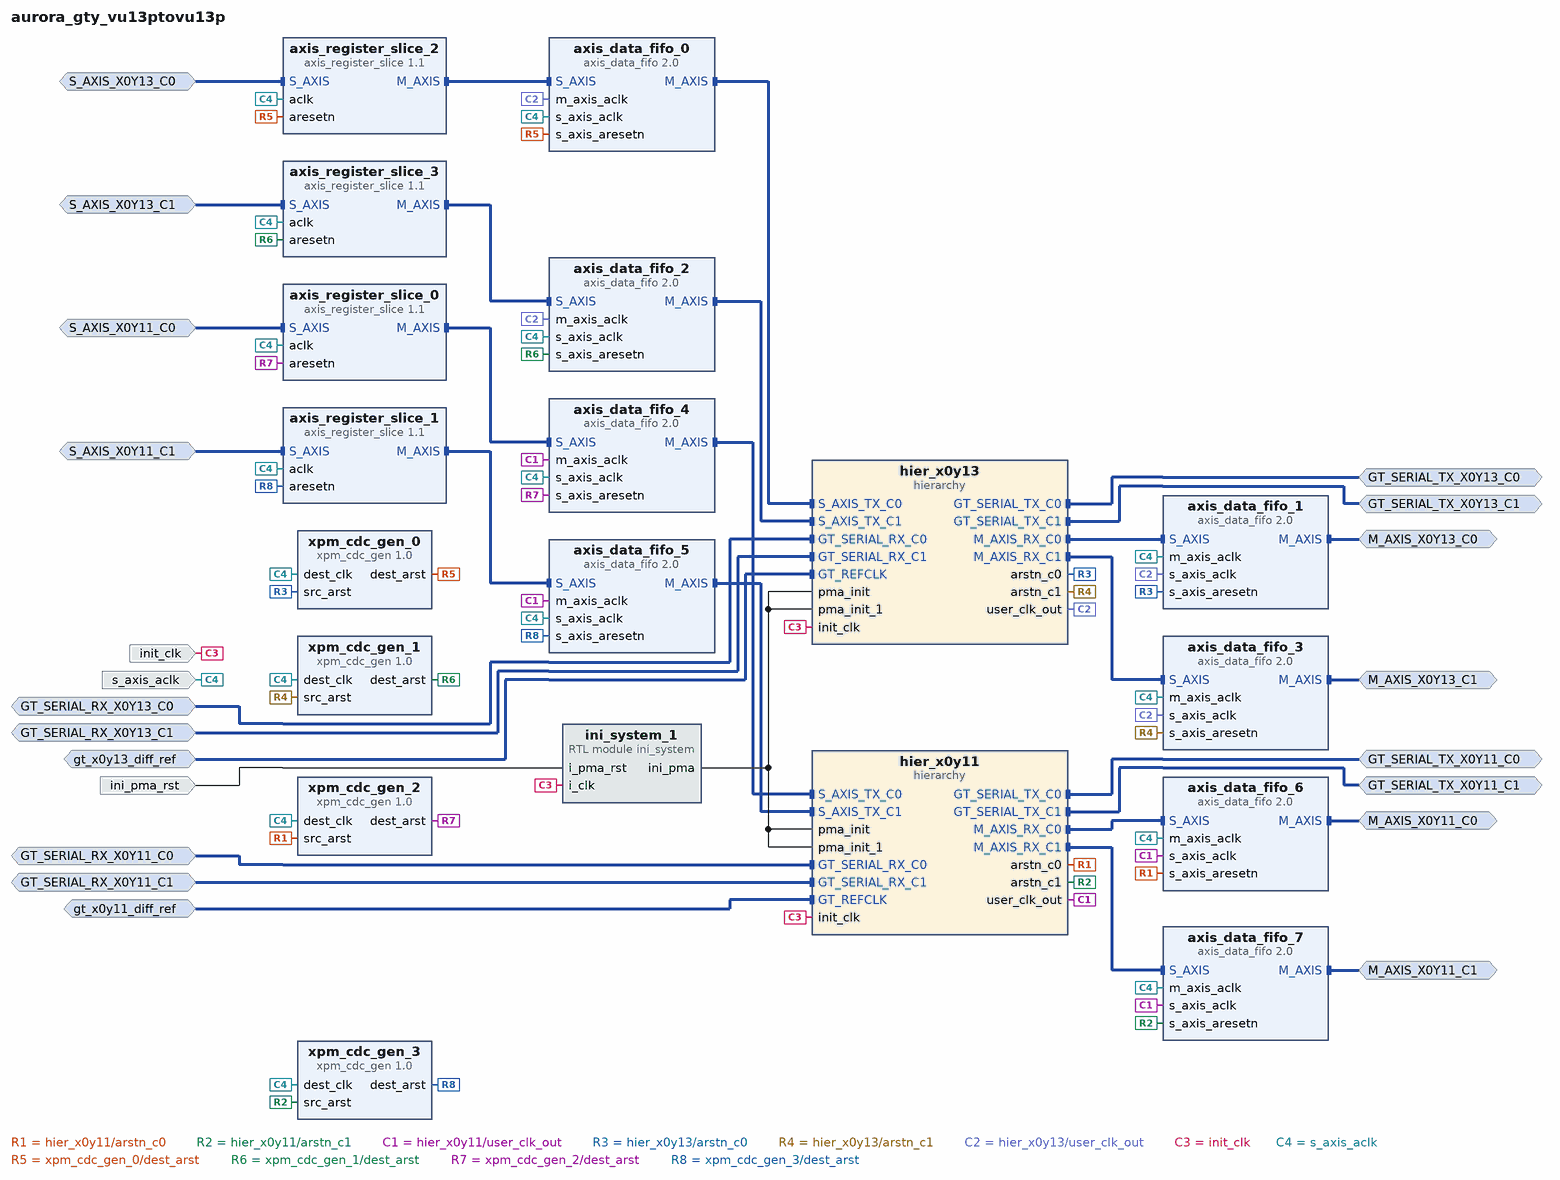
[diagram p0: block diagram of the top level]
# Vivado block design aurora_gty_vu13ptovu13p, xcvu13p-fhgb2104-2-i, Vivado 2025.2
create_bd_design aurora_gty_vu13ptovu13p

create_bd_intf_port -mode Slave -vlnv xilinx.com:interface:axis_rtl:1.0 S_AXIS_X0Y11_C0
set_property -dict [list \
  CONFIG.FREQ_HZ 256000000 \
  CONFIG.HAS_TKEEP 0 \
  CONFIG.HAS_TLAST 1 \
  CONFIG.HAS_TREADY 1 \
  CONFIG.HAS_TSTRB 0 \
  CONFIG.LAYERED_METADATA undef \
  CONFIG.TDATA_NUM_BYTES 16 \
  CONFIG.TDEST_WIDTH 0 \
  CONFIG.TID_WIDTH 0 \
  CONFIG.TUSER_WIDTH 64 \
] [get_bd_intf_ports S_AXIS_X0Y11_C0]
create_bd_intf_port -mode Slave -vlnv xilinx.com:interface:axis_rtl:1.0 S_AXIS_X0Y13_C1
set_property -dict [list \
  CONFIG.FREQ_HZ 256000000 \
  CONFIG.HAS_TKEEP 0 \
  CONFIG.HAS_TLAST 1 \
  CONFIG.HAS_TREADY 1 \
  CONFIG.HAS_TSTRB 0 \
  CONFIG.LAYERED_METADATA undef \
  CONFIG.TDATA_NUM_BYTES 16 \
  CONFIG.TDEST_WIDTH 0 \
  CONFIG.TID_WIDTH 0 \
  CONFIG.TUSER_WIDTH 64 \
] [get_bd_intf_ports S_AXIS_X0Y13_C1]
create_bd_intf_port -mode Master -vlnv xilinx.com:interface:axis_rtl:1.0 M_AXIS_X0Y11_C0
set_property -dict {CONFIG.FREQ_HZ 256000000} [get_bd_intf_ports M_AXIS_X0Y11_C0]
create_bd_intf_port -mode Master -vlnv xilinx.com:interface:axis_rtl:1.0 M_AXIS_X0Y13_C0
set_property -dict {CONFIG.FREQ_HZ 256000000} [get_bd_intf_ports M_AXIS_X0Y13_C0]
create_bd_intf_port -mode Master -vlnv xilinx.com:interface:axis_rtl:1.0 M_AXIS_X0Y11_C1
set_property -dict {CONFIG.FREQ_HZ 256000000} [get_bd_intf_ports M_AXIS_X0Y11_C1]
create_bd_intf_port -mode Slave -vlnv xilinx.com:interface:diff_clock_rtl:1.0 gt_x0y11_diff_ref
set_property -dict {CONFIG.FREQ_HZ 156250000} [get_bd_intf_ports gt_x0y11_diff_ref]
create_bd_intf_port -mode Slave -vlnv xilinx.com:interface:axis_rtl:1.0 S_AXIS_X0Y11_C1
set_property -dict [list \
  CONFIG.FREQ_HZ 256000000 \
  CONFIG.HAS_TKEEP 0 \
  CONFIG.HAS_TLAST 1 \
  CONFIG.HAS_TREADY 1 \
  CONFIG.HAS_TSTRB 0 \
  CONFIG.LAYERED_METADATA undef \
  CONFIG.TDATA_NUM_BYTES 16 \
  CONFIG.TDEST_WIDTH 0 \
  CONFIG.TID_WIDTH 0 \
  CONFIG.TUSER_WIDTH 64 \
] [get_bd_intf_ports S_AXIS_X0Y11_C1]
create_bd_intf_port -mode Master -vlnv xilinx.com:interface:axis_rtl:1.0 M_AXIS_X0Y13_C1
set_property -dict {CONFIG.FREQ_HZ 256000000} [get_bd_intf_ports M_AXIS_X0Y13_C1]
create_bd_intf_port -mode Slave -vlnv xilinx.com:display_aurora64b66b:GT_Serial_Transceiver_Pins_RX_rtl:1.0 GT_SERIAL_RX_X0Y13_C0
create_bd_intf_port -mode Master -vlnv xilinx.com:display_aurora64b66b:GT_Serial_Transceiver_Pins_TX_rtl:1.0 GT_SERIAL_TX_X0Y13_C0
create_bd_intf_port -mode Slave -vlnv xilinx.com:display_aurora64b66b:GT_Serial_Transceiver_Pins_RX_rtl:1.0 GT_SERIAL_RX_X0Y11_C0
create_bd_intf_port -mode Master -vlnv xilinx.com:display_aurora64b66b:GT_Serial_Transceiver_Pins_TX_rtl:1.0 GT_SERIAL_TX_X0Y11_C0
create_bd_intf_port -mode Slave -vlnv xilinx.com:display_aurora64b66b:GT_Serial_Transceiver_Pins_RX_rtl:1.0 GT_SERIAL_RX_X0Y13_C1
create_bd_intf_port -mode Master -vlnv xilinx.com:display_aurora64b66b:GT_Serial_Transceiver_Pins_TX_rtl:1.0 GT_SERIAL_TX_X0Y13_C1
create_bd_intf_port -mode Slave -vlnv xilinx.com:display_aurora64b66b:GT_Serial_Transceiver_Pins_RX_rtl:1.0 GT_SERIAL_RX_X0Y11_C1
create_bd_intf_port -mode Master -vlnv xilinx.com:display_aurora64b66b:GT_Serial_Transceiver_Pins_TX_rtl:1.0 GT_SERIAL_TX_X0Y11_C1
create_bd_intf_port -mode Slave -vlnv xilinx.com:interface:axis_rtl:1.0 S_AXIS_X0Y13_C0
set_property -dict [list \
  CONFIG.FREQ_HZ 256000000 \
  CONFIG.HAS_TKEEP 0 \
  CONFIG.HAS_TLAST 1 \
  CONFIG.HAS_TREADY 1 \
  CONFIG.HAS_TSTRB 0 \
  CONFIG.LAYERED_METADATA undef \
  CONFIG.TDATA_NUM_BYTES 16 \
  CONFIG.TDEST_WIDTH 0 \
  CONFIG.TID_WIDTH 0 \
  CONFIG.TUSER_WIDTH 64 \
] [get_bd_intf_ports S_AXIS_X0Y13_C0]
create_bd_intf_port -mode Slave -vlnv xilinx.com:interface:diff_clock_rtl:1.0 gt_x0y13_diff_ref
set_property -dict {CONFIG.FREQ_HZ 156250000} [get_bd_intf_ports gt_x0y13_diff_ref]
create_bd_port -dir I -type rst ini_pma_rst
create_bd_port -dir I -type clk s_axis_aclk
set_property -dict [list \
  CONFIG.ASSOCIATED_BUSIF S_AXIS_X0Y11_C0:S_AXIS_X0Y13_C1:M_AXIS_X0Y11_C0:M_AXIS_X0Y13_C0:M_AXIS_X0Y11_C0_1:S_AXIS_X0Y11_C0_1:M_AXIS_X0Y13_C0_1:S_AXIS_X0Y13_C1_1:M_AXIS_X0Y11_C1:S_AXIS_X0Y11_C1:M_AXIS_X0Y13_C1:S_AXIS_X0Y13_C0 \
  CONFIG.FREQ_HZ 256000000 \
] [get_bd_ports s_axis_aclk]
create_bd_port -dir I -type clk init_clk
set_property -dict {CONFIG.ASSOCIATED_RESET ini_pma_rst CONFIG.FREQ_HZ 100000000} [get_bd_ports init_clk]

create_bd_cell -type hier hier_x0y13
create_bd_cell -type hier hier_x0y11
create_bd_cell -type module -reference ini_system ini_system_1
create_bd_cell -type ip -vlnv xilinx.com:ip:axis_data_fifo:2.0 axis_data_fifo_0
set_property -dict [list \
  CONFIG.FIFO_DEPTH 512 \
  CONFIG.HAS_TLAST 1 \
  CONFIG.IS_ACLK_ASYNC 1 \
  CONFIG.TDATA_NUM_BYTES 16 \
  CONFIG.TUSER_WIDTH 64 \
] [get_bd_cells axis_data_fifo_0]
create_bd_cell -type ip -vlnv xilinx.com:ip:axis_data_fifo:2.0 axis_data_fifo_2
set_property -dict [list \
  CONFIG.FIFO_DEPTH 512 \
  CONFIG.HAS_TLAST 1 \
  CONFIG.IS_ACLK_ASYNC 1 \
  CONFIG.TDATA_NUM_BYTES 16 \
  CONFIG.TUSER_WIDTH 64 \
] [get_bd_cells axis_data_fifo_2]
create_bd_cell -type ip -vlnv xilinx.com:ip:xpm_cdc_gen:1.0 xpm_cdc_gen_0
set_property -dict {CONFIG.CDC_TYPE xpm_cdc_async_rst} [get_bd_cells xpm_cdc_gen_0]
create_bd_cell -type ip -vlnv xilinx.com:ip:xpm_cdc_gen:1.0 xpm_cdc_gen_1
set_property -dict {CONFIG.CDC_TYPE xpm_cdc_async_rst} [get_bd_cells xpm_cdc_gen_1]
create_bd_cell -type ip -vlnv xilinx.com:ip:axis_data_fifo:2.0 axis_data_fifo_1
set_property -dict [list \
  CONFIG.FIFO_DEPTH 512 \
  CONFIG.HAS_TLAST 1 \
  CONFIG.IS_ACLK_ASYNC 1 \
  CONFIG.TDATA_NUM_BYTES 16 \
  CONFIG.TUSER_WIDTH 64 \
] [get_bd_cells axis_data_fifo_1]
create_bd_cell -type ip -vlnv xilinx.com:ip:axis_data_fifo:2.0 axis_data_fifo_3
set_property -dict [list \
  CONFIG.FIFO_DEPTH 512 \
  CONFIG.HAS_TLAST 1 \
  CONFIG.IS_ACLK_ASYNC 1 \
  CONFIG.TDATA_NUM_BYTES 16 \
  CONFIG.TUSER_WIDTH 64 \
] [get_bd_cells axis_data_fifo_3]
create_bd_cell -type ip -vlnv xilinx.com:ip:axis_data_fifo:2.0 axis_data_fifo_4
set_property -dict [list \
  CONFIG.FIFO_DEPTH 512 \
  CONFIG.HAS_TLAST 1 \
  CONFIG.IS_ACLK_ASYNC 1 \
  CONFIG.TDATA_NUM_BYTES 16 \
  CONFIG.TUSER_WIDTH 64 \
] [get_bd_cells axis_data_fifo_4]
create_bd_cell -type ip -vlnv xilinx.com:ip:axis_data_fifo:2.0 axis_data_fifo_5
set_property -dict [list \
  CONFIG.FIFO_DEPTH 512 \
  CONFIG.HAS_TLAST 1 \
  CONFIG.IS_ACLK_ASYNC 1 \
  CONFIG.TDATA_NUM_BYTES 16 \
  CONFIG.TUSER_WIDTH 64 \
] [get_bd_cells axis_data_fifo_5]
create_bd_cell -type ip -vlnv xilinx.com:ip:xpm_cdc_gen:1.0 xpm_cdc_gen_2
set_property -dict {CONFIG.CDC_TYPE xpm_cdc_async_rst} [get_bd_cells xpm_cdc_gen_2]
create_bd_cell -type ip -vlnv xilinx.com:ip:xpm_cdc_gen:1.0 xpm_cdc_gen_3
set_property -dict {CONFIG.CDC_TYPE xpm_cdc_async_rst} [get_bd_cells xpm_cdc_gen_3]
create_bd_cell -type ip -vlnv xilinx.com:ip:axis_data_fifo:2.0 axis_data_fifo_6
set_property -dict [list \
  CONFIG.FIFO_DEPTH 512 \
  CONFIG.HAS_TLAST 1 \
  CONFIG.IS_ACLK_ASYNC 1 \
  CONFIG.TDATA_NUM_BYTES 16 \
  CONFIG.TUSER_WIDTH 64 \
] [get_bd_cells axis_data_fifo_6]
create_bd_cell -type ip -vlnv xilinx.com:ip:axis_data_fifo:2.0 axis_data_fifo_7
set_property -dict [list \
  CONFIG.FIFO_DEPTH 512 \
  CONFIG.HAS_TLAST 1 \
  CONFIG.IS_ACLK_ASYNC 1 \
  CONFIG.TDATA_NUM_BYTES 16 \
  CONFIG.TUSER_WIDTH 64 \
] [get_bd_cells axis_data_fifo_7]
create_bd_cell -type ip -vlnv xilinx.com:ip:axis_register_slice:1.1 axis_register_slice_0
set_property -dict [list \
  CONFIG.NUM_SLR_CROSSINGS 3 \
  CONFIG.PIPELINES_MASTER 2 \
  CONFIG.PIPELINES_MIDDLE 2 \
  CONFIG.PIPELINES_SLAVE 2 \
  CONFIG.REG_CONFIG 15 \
] [get_bd_cells axis_register_slice_0]
create_bd_cell -type ip -vlnv xilinx.com:ip:axis_register_slice:1.1 axis_register_slice_1
set_property -dict [list \
  CONFIG.NUM_SLR_CROSSINGS 3 \
  CONFIG.PIPELINES_MASTER 2 \
  CONFIG.PIPELINES_MIDDLE 2 \
  CONFIG.PIPELINES_SLAVE 2 \
  CONFIG.REG_CONFIG 15 \
] [get_bd_cells axis_register_slice_1]
create_bd_cell -type ip -vlnv xilinx.com:ip:axis_register_slice:1.1 axis_register_slice_2
set_property -dict [list \
  CONFIG.NUM_SLR_CROSSINGS 3 \
  CONFIG.PIPELINES_MASTER 2 \
  CONFIG.PIPELINES_MIDDLE 2 \
  CONFIG.PIPELINES_SLAVE 2 \
  CONFIG.REG_CONFIG 15 \
] [get_bd_cells axis_register_slice_2]
create_bd_cell -type ip -vlnv xilinx.com:ip:axis_register_slice:1.1 axis_register_slice_3
set_property -dict [list \
  CONFIG.NUM_SLR_CROSSINGS 3 \
  CONFIG.PIPELINES_MASTER 2 \
  CONFIG.PIPELINES_MIDDLE 2 \
  CONFIG.PIPELINES_SLAVE 2 \
  CONFIG.REG_CONFIG 15 \
] [get_bd_cells axis_register_slice_3]

# ---- hierarchy /hier_x0y13 ----
current_bd_instance /hier_x0y13
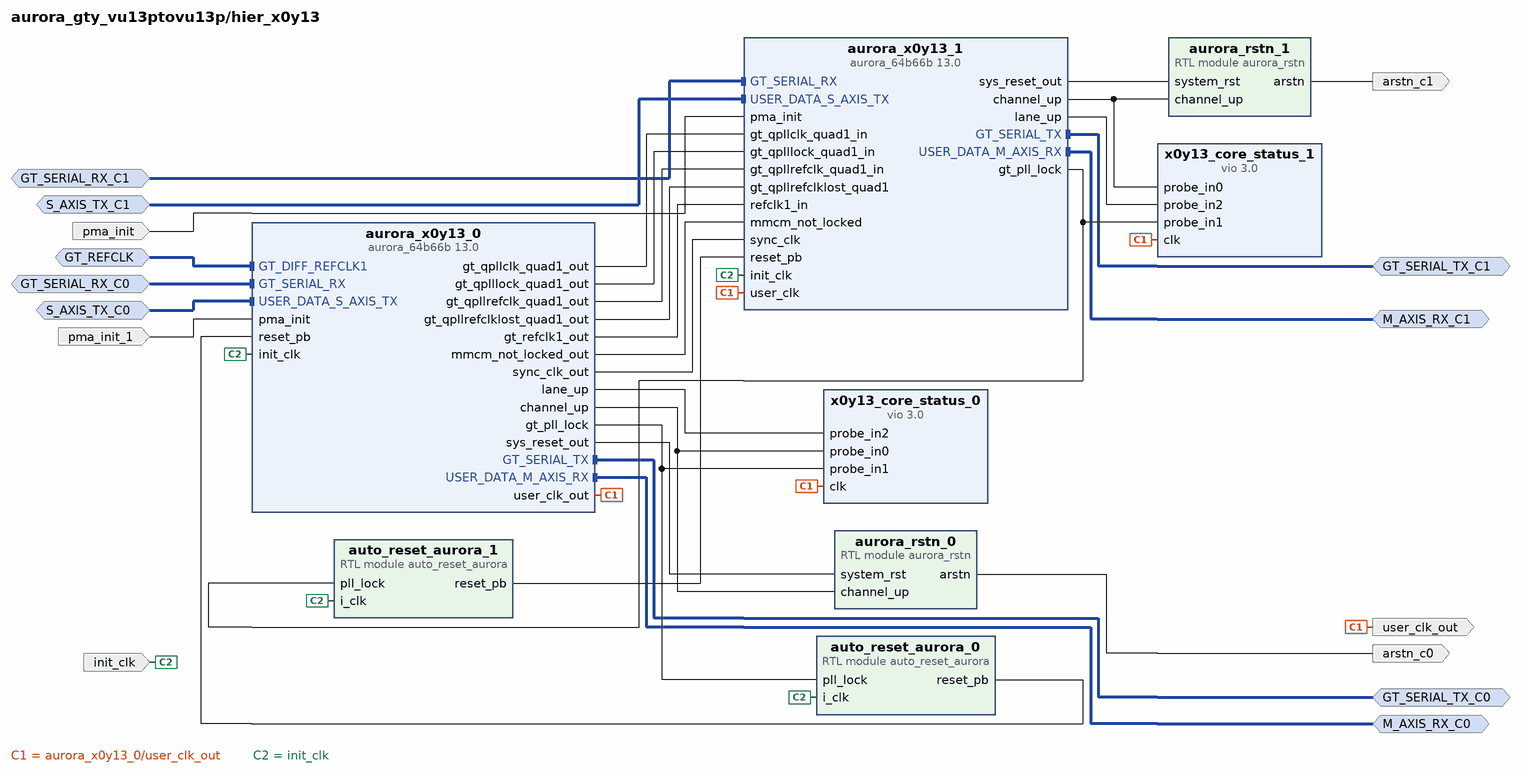
[diagram p1: block diagram inside /hier_x0y13]
create_bd_intf_pin -mode Slave -vlnv xilinx.com:interface:axis_rtl:1.0 S_AXIS_TX_C0
create_bd_intf_pin -mode Master -vlnv xilinx.com:interface:axis_rtl:1.0 M_AXIS_RX_C0
create_bd_intf_pin -mode Slave -vlnv xilinx.com:interface:diff_clock_rtl:1.0 GT_REFCLK
create_bd_intf_pin -mode Master -vlnv xilinx.com:display_aurora64b66b:GT_Serial_Transceiver_Pins_TX_rtl:1.0 GT_SERIAL_TX_C0
create_bd_intf_pin -mode Slave -vlnv xilinx.com:display_aurora64b66b:GT_Serial_Transceiver_Pins_RX_rtl:1.0 GT_SERIAL_RX_C0
create_bd_intf_pin -mode Slave -vlnv xilinx.com:interface:axis_rtl:1.0 S_AXIS_TX_C1
create_bd_intf_pin -mode Master -vlnv xilinx.com:interface:axis_rtl:1.0 M_AXIS_RX_C1
create_bd_intf_pin -mode Master -vlnv xilinx.com:display_aurora64b66b:GT_Serial_Transceiver_Pins_TX_rtl:1.0 GT_SERIAL_TX_C1
create_bd_intf_pin -mode Slave -vlnv xilinx.com:display_aurora64b66b:GT_Serial_Transceiver_Pins_RX_rtl:1.0 GT_SERIAL_RX_C1
create_bd_pin -dir O -type clk user_clk_out
create_bd_pin -dir I -type clk init_clk
create_bd_pin -dir I -type rst pma_init
create_bd_pin -dir I -type rst pma_init_1
create_bd_pin -dir O arstn_c0
create_bd_pin -dir O arstn_c1

create_bd_cell -type ip -vlnv xilinx.com:ip:vio:3.0 x0y13_core_status_0
set_property -dict [list \
  CONFIG.C_NUM_PROBE_IN 3 \
  CONFIG.C_NUM_PROBE_OUT 0 \
  CONFIG.C_PROBE_IN2_WIDTH 2 \
  CONFIG.C_PROBE_IN5_WIDTH 2 \
] [get_bd_cells x0y13_core_status_0]
create_bd_cell -type ip -vlnv xilinx.com:ip:aurora_64b66b:13.0 aurora_x0y13_0
set_property -dict [list \
  CONFIG.C_AURORA_LANES 2 \
  CONFIG.C_LINE_RATE 25.625 \
  CONFIG.C_START_QUAD Quad_X0Y13 \
  CONFIG.C_UCOLUMN_USED left \
  CONFIG.SupportLevel 1 \
  CONFIG.drp_mode Disabled \
  CONFIG.interface_mode Framing \
] [get_bd_cells aurora_x0y13_0]
create_bd_cell -type ip -vlnv xilinx.com:ip:aurora_64b66b:13.0 aurora_x0y13_1
set_property -dict [list \
  CONFIG.C_AURORA_LANES 2 \
  CONFIG.C_LINE_RATE 25.625 \
  CONFIG.C_START_LANE X0Y54 \
  CONFIG.C_START_QUAD Quad_X0Y13 \
  CONFIG.C_UCOLUMN_USED left \
  CONFIG.SupportLevel 0 \
  CONFIG.drp_mode Disabled \
  CONFIG.interface_mode Framing \
] [get_bd_cells aurora_x0y13_1]
create_bd_cell -type ip -vlnv xilinx.com:ip:vio:3.0 x0y13_core_status_1
set_property -dict [list \
  CONFIG.C_NUM_PROBE_IN 3 \
  CONFIG.C_NUM_PROBE_OUT 0 \
  CONFIG.C_PROBE_IN2_WIDTH 2 \
] [get_bd_cells x0y13_core_status_1]
create_bd_cell -type module -reference auto_reset_aurora auto_reset_aurora_0
create_bd_cell -type module -reference auto_reset_aurora auto_reset_aurora_1
create_bd_cell -type module -reference aurora_rstn aurora_rstn_0
create_bd_cell -type module -reference aurora_rstn aurora_rstn_1

# ---- hierarchy /hier_x0y11 ----
current_bd_instance /hier_x0y11
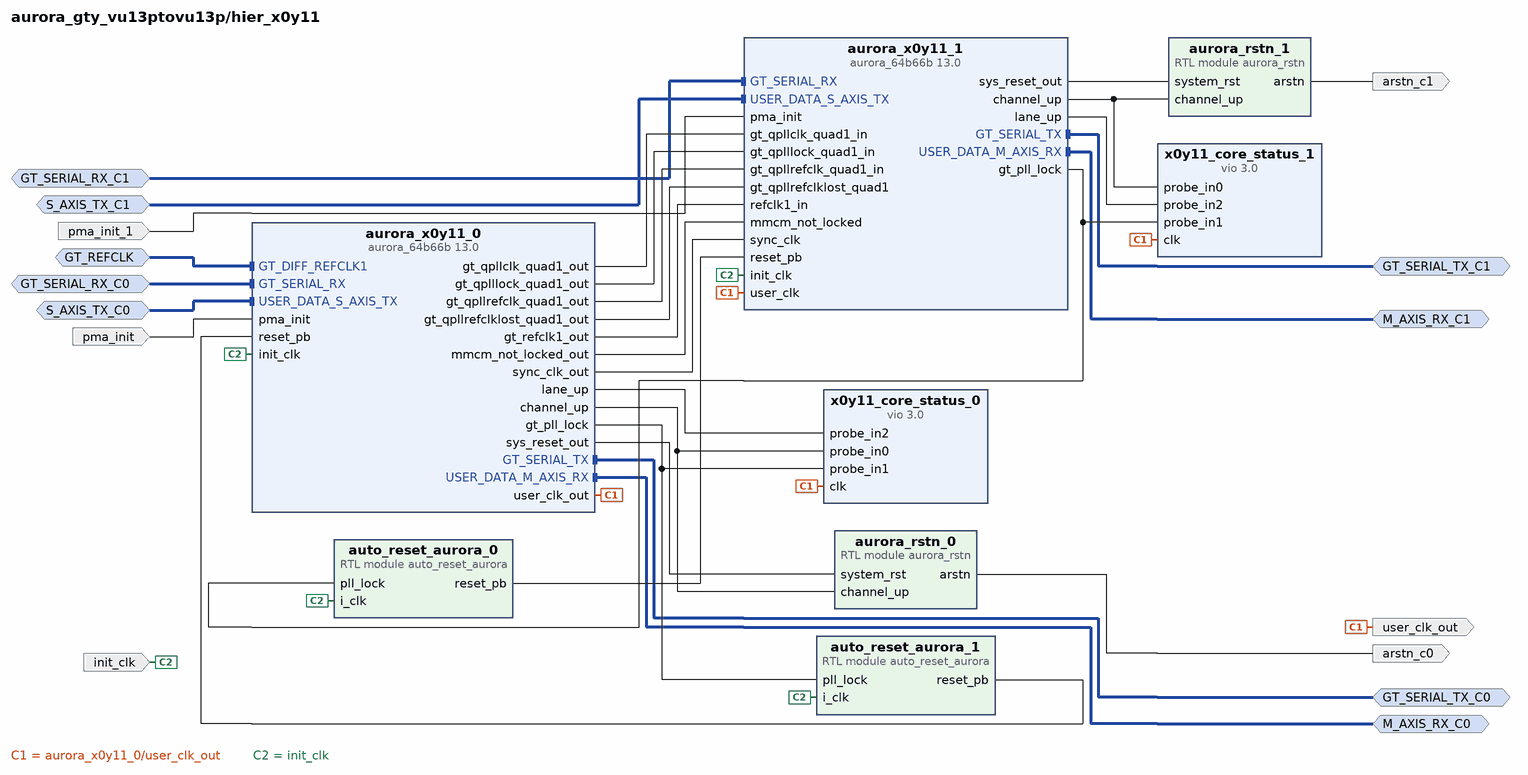
[diagram p2: block diagram inside /hier_x0y11]
create_bd_intf_pin -mode Slave -vlnv xilinx.com:interface:axis_rtl:1.0 S_AXIS_TX_C0
create_bd_intf_pin -mode Master -vlnv xilinx.com:interface:axis_rtl:1.0 M_AXIS_RX_C0
create_bd_intf_pin -mode Slave -vlnv xilinx.com:interface:diff_clock_rtl:1.0 GT_REFCLK
create_bd_intf_pin -mode Master -vlnv xilinx.com:display_aurora64b66b:GT_Serial_Transceiver_Pins_TX_rtl:1.0 GT_SERIAL_TX_C0
create_bd_intf_pin -mode Slave -vlnv xilinx.com:display_aurora64b66b:GT_Serial_Transceiver_Pins_RX_rtl:1.0 GT_SERIAL_RX_C0
create_bd_intf_pin -mode Slave -vlnv xilinx.com:interface:axis_rtl:1.0 S_AXIS_TX_C1
create_bd_intf_pin -mode Master -vlnv xilinx.com:interface:axis_rtl:1.0 M_AXIS_RX_C1
create_bd_intf_pin -mode Master -vlnv xilinx.com:display_aurora64b66b:GT_Serial_Transceiver_Pins_TX_rtl:1.0 GT_SERIAL_TX_C1
create_bd_intf_pin -mode Slave -vlnv xilinx.com:display_aurora64b66b:GT_Serial_Transceiver_Pins_RX_rtl:1.0 GT_SERIAL_RX_C1
create_bd_pin -dir I -type clk init_clk
create_bd_pin -dir O -type clk user_clk_out
create_bd_pin -dir I -type rst pma_init
create_bd_pin -dir I -type rst pma_init_1
create_bd_pin -dir O arstn_c0
create_bd_pin -dir O arstn_c1

create_bd_cell -type ip -vlnv xilinx.com:ip:aurora_64b66b:13.0 aurora_x0y11_0
set_property -dict [list \
  CONFIG.C_AURORA_LANES 2 \
  CONFIG.C_LINE_RATE 25.625 \
  CONFIG.C_START_QUAD Quad_X0Y11 \
  CONFIG.C_UCOLUMN_USED left \
  CONFIG.SupportLevel 1 \
  CONFIG.drp_mode Disabled \
  CONFIG.interface_mode Framing \
] [get_bd_cells aurora_x0y11_0]
create_bd_cell -type ip -vlnv xilinx.com:ip:vio:3.0 x0y11_core_status_1
set_property -dict [list \
  CONFIG.C_NUM_PROBE_IN 3 \
  CONFIG.C_NUM_PROBE_OUT 0 \
  CONFIG.C_PROBE_IN2_WIDTH 2 \
] [get_bd_cells x0y11_core_status_1]
create_bd_cell -type ip -vlnv xilinx.com:ip:aurora_64b66b:13.0 aurora_x0y11_1
set_property -dict [list \
  CONFIG.C_AURORA_LANES 2 \
  CONFIG.C_LINE_RATE 25.625 \
  CONFIG.C_START_LANE X0Y46 \
  CONFIG.C_START_QUAD Quad_X0Y11 \
  CONFIG.C_UCOLUMN_USED left \
  CONFIG.SupportLevel 0 \
  CONFIG.drp_mode Disabled \
  CONFIG.interface_mode Framing \
] [get_bd_cells aurora_x0y11_1]
create_bd_cell -type ip -vlnv xilinx.com:ip:vio:3.0 x0y11_core_status_0
set_property -dict [list \
  CONFIG.C_NUM_PROBE_IN 3 \
  CONFIG.C_NUM_PROBE_OUT 0 \
  CONFIG.C_PROBE_IN2_WIDTH 2 \
  CONFIG.C_PROBE_IN5_WIDTH 2 \
] [get_bd_cells x0y11_core_status_0]
create_bd_cell -type module -reference auto_reset_aurora auto_reset_aurora_0
create_bd_cell -type module -reference auto_reset_aurora auto_reset_aurora_1
create_bd_cell -type module -reference aurora_rstn aurora_rstn_0
create_bd_cell -type module -reference aurora_rstn aurora_rstn_1

# ---- connections ----

current_bd_instance /hier_x0y13
connect_bd_intf_net [get_bd_intf_pins GT_REFCLK] [get_bd_intf_pins aurora_x0y13_0/GT_DIFF_REFCLK1]
connect_bd_intf_net [get_bd_intf_pins GT_SERIAL_RX_C0] [get_bd_intf_pins aurora_x0y13_0/GT_SERIAL_RX]
connect_bd_intf_net [get_bd_intf_pins GT_SERIAL_RX_C1] [get_bd_intf_pins aurora_x0y13_1/GT_SERIAL_RX]
connect_bd_intf_net [get_bd_intf_pins S_AXIS_TX_C0] [get_bd_intf_pins aurora_x0y13_0/USER_DATA_S_AXIS_TX]
connect_bd_intf_net [get_bd_intf_pins S_AXIS_TX_C1] [get_bd_intf_pins aurora_x0y13_1/USER_DATA_S_AXIS_TX]
connect_bd_intf_net [get_bd_intf_pins GT_SERIAL_TX_C0] [get_bd_intf_pins aurora_x0y13_0/GT_SERIAL_TX]
connect_bd_intf_net [get_bd_intf_pins M_AXIS_RX_C0] [get_bd_intf_pins aurora_x0y13_0/USER_DATA_M_AXIS_RX]
connect_bd_intf_net [get_bd_intf_pins GT_SERIAL_TX_C1] [get_bd_intf_pins aurora_x0y13_1/GT_SERIAL_TX]
connect_bd_intf_net [get_bd_intf_pins M_AXIS_RX_C1] [get_bd_intf_pins aurora_x0y13_1/USER_DATA_M_AXIS_RX]
connect_bd_net [get_bd_pins aurora_rstn_0/arstn] [get_bd_pins arstn_c0]
connect_bd_net [get_bd_pins aurora_rstn_1/arstn] [get_bd_pins arstn_c1]
connect_bd_net [get_bd_pins aurora_x0y13_0/channel_up] [get_bd_pins x0y13_core_status_0/probe_in0] [get_bd_pins aurora_rstn_0/channel_up]
connect_bd_net [get_bd_pins aurora_x0y13_0/gt_pll_lock] [get_bd_pins x0y13_core_status_0/probe_in1] [get_bd_pins auto_reset_aurora_0/pll_lock]
connect_bd_net [get_bd_pins aurora_x0y13_0/gt_qpllclk_quad1_out] [get_bd_pins aurora_x0y13_1/gt_qpllclk_quad1_in]
connect_bd_net [get_bd_pins aurora_x0y13_0/gt_qplllock_quad1_out] [get_bd_pins aurora_x0y13_1/gt_qplllock_quad1_in]
connect_bd_net [get_bd_pins aurora_x0y13_0/gt_qpllrefclk_quad1_out] [get_bd_pins aurora_x0y13_1/gt_qpllrefclk_quad1_in]
connect_bd_net [get_bd_pins aurora_x0y13_0/gt_qpllrefclklost_quad1_out] [get_bd_pins aurora_x0y13_1/gt_qpllrefclklost_quad1]
connect_bd_net [get_bd_pins aurora_x0y13_0/gt_refclk1_out] [get_bd_pins aurora_x0y13_1/refclk1_in]
connect_bd_net [get_bd_pins aurora_x0y13_0/lane_up] [get_bd_pins x0y13_core_status_0/probe_in2]
connect_bd_net [get_bd_pins aurora_x0y13_0/mmcm_not_locked_out] [get_bd_pins aurora_x0y13_1/mmcm_not_locked]
connect_bd_net [get_bd_pins aurora_x0y13_0/sync_clk_out] [get_bd_pins aurora_x0y13_1/sync_clk]
connect_bd_net [get_bd_pins aurora_x0y13_0/sys_reset_out] [get_bd_pins aurora_rstn_0/system_rst]
connect_bd_net [get_bd_pins aurora_x0y13_0/user_clk_out] \
  [get_bd_pins user_clk_out] [get_bd_pins aurora_x0y13_1/user_clk] [get_bd_pins x0y13_core_status_1/clk] \
  [get_bd_pins x0y13_core_status_0/clk]
connect_bd_net [get_bd_pins aurora_x0y13_1/channel_up] [get_bd_pins x0y13_core_status_1/probe_in0] [get_bd_pins aurora_rstn_1/channel_up]
connect_bd_net [get_bd_pins aurora_x0y13_1/gt_pll_lock] [get_bd_pins x0y13_core_status_1/probe_in1] [get_bd_pins auto_reset_aurora_1/pll_lock]
connect_bd_net [get_bd_pins aurora_x0y13_1/lane_up] [get_bd_pins x0y13_core_status_1/probe_in2]
connect_bd_net [get_bd_pins aurora_x0y13_1/sys_reset_out] [get_bd_pins aurora_rstn_1/system_rst]
connect_bd_net [get_bd_pins auto_reset_aurora_0/reset_pb] [get_bd_pins aurora_x0y13_0/reset_pb]
connect_bd_net [get_bd_pins auto_reset_aurora_1/reset_pb] [get_bd_pins aurora_x0y13_1/reset_pb]
connect_bd_net [get_bd_pins init_clk] \
  [get_bd_pins aurora_x0y13_1/init_clk] [get_bd_pins aurora_x0y13_0/init_clk] [get_bd_pins auto_reset_aurora_0/i_clk] \
  [get_bd_pins auto_reset_aurora_1/i_clk]
connect_bd_net [get_bd_pins pma_init] [get_bd_pins aurora_x0y13_1/pma_init]
connect_bd_net [get_bd_pins pma_init_1] [get_bd_pins aurora_x0y13_0/pma_init]

current_bd_instance /hier_x0y11
connect_bd_intf_net [get_bd_intf_pins GT_REFCLK] [get_bd_intf_pins aurora_x0y11_0/GT_DIFF_REFCLK1]
connect_bd_intf_net [get_bd_intf_pins GT_SERIAL_RX_C0] [get_bd_intf_pins aurora_x0y11_0/GT_SERIAL_RX]
connect_bd_intf_net [get_bd_intf_pins GT_SERIAL_RX_C1] [get_bd_intf_pins aurora_x0y11_1/GT_SERIAL_RX]
connect_bd_intf_net [get_bd_intf_pins S_AXIS_TX_C0] [get_bd_intf_pins aurora_x0y11_0/USER_DATA_S_AXIS_TX]
connect_bd_intf_net [get_bd_intf_pins S_AXIS_TX_C1] [get_bd_intf_pins aurora_x0y11_1/USER_DATA_S_AXIS_TX]
connect_bd_intf_net [get_bd_intf_pins GT_SERIAL_TX_C0] [get_bd_intf_pins aurora_x0y11_0/GT_SERIAL_TX]
connect_bd_intf_net [get_bd_intf_pins M_AXIS_RX_C0] [get_bd_intf_pins aurora_x0y11_0/USER_DATA_M_AXIS_RX]
connect_bd_intf_net [get_bd_intf_pins GT_SERIAL_TX_C1] [get_bd_intf_pins aurora_x0y11_1/GT_SERIAL_TX]
connect_bd_intf_net [get_bd_intf_pins M_AXIS_RX_C1] [get_bd_intf_pins aurora_x0y11_1/USER_DATA_M_AXIS_RX]
connect_bd_net [get_bd_pins aurora_rstn_0/arstn] [get_bd_pins arstn_c0]
connect_bd_net [get_bd_pins aurora_rstn_1/arstn] [get_bd_pins arstn_c1]
connect_bd_net [get_bd_pins aurora_x0y11_0/channel_up] [get_bd_pins x0y11_core_status_0/probe_in0] [get_bd_pins aurora_rstn_0/channel_up]
connect_bd_net [get_bd_pins aurora_x0y11_0/gt_pll_lock] [get_bd_pins x0y11_core_status_0/probe_in1] [get_bd_pins auto_reset_aurora_1/pll_lock]
connect_bd_net [get_bd_pins aurora_x0y11_0/gt_qpllclk_quad1_out] [get_bd_pins aurora_x0y11_1/gt_qpllclk_quad1_in]
connect_bd_net [get_bd_pins aurora_x0y11_0/gt_qplllock_quad1_out] [get_bd_pins aurora_x0y11_1/gt_qplllock_quad1_in]
connect_bd_net [get_bd_pins aurora_x0y11_0/gt_qpllrefclk_quad1_out] [get_bd_pins aurora_x0y11_1/gt_qpllrefclk_quad1_in]
connect_bd_net [get_bd_pins aurora_x0y11_0/gt_qpllrefclklost_quad1_out] [get_bd_pins aurora_x0y11_1/gt_qpllrefclklost_quad1]
connect_bd_net [get_bd_pins aurora_x0y11_0/gt_refclk1_out] [get_bd_pins aurora_x0y11_1/refclk1_in]
connect_bd_net [get_bd_pins aurora_x0y11_0/lane_up] [get_bd_pins x0y11_core_status_0/probe_in2]
connect_bd_net [get_bd_pins aurora_x0y11_0/mmcm_not_locked_out] [get_bd_pins aurora_x0y11_1/mmcm_not_locked]
connect_bd_net [get_bd_pins aurora_x0y11_0/sync_clk_out] [get_bd_pins aurora_x0y11_1/sync_clk]
connect_bd_net [get_bd_pins aurora_x0y11_0/sys_reset_out] [get_bd_pins aurora_rstn_0/system_rst]
connect_bd_net [get_bd_pins aurora_x0y11_0/user_clk_out] \
  [get_bd_pins user_clk_out] [get_bd_pins x0y11_core_status_0/clk] [get_bd_pins x0y11_core_status_1/clk] \
  [get_bd_pins aurora_x0y11_1/user_clk]
connect_bd_net [get_bd_pins aurora_x0y11_1/channel_up] [get_bd_pins x0y11_core_status_1/probe_in0] [get_bd_pins aurora_rstn_1/channel_up]
connect_bd_net [get_bd_pins aurora_x0y11_1/gt_pll_lock] [get_bd_pins x0y11_core_status_1/probe_in1] [get_bd_pins auto_reset_aurora_0/pll_lock]
connect_bd_net [get_bd_pins aurora_x0y11_1/lane_up] [get_bd_pins x0y11_core_status_1/probe_in2]
connect_bd_net [get_bd_pins aurora_x0y11_1/sys_reset_out] [get_bd_pins aurora_rstn_1/system_rst]
connect_bd_net [get_bd_pins auto_reset_aurora_0/reset_pb] [get_bd_pins aurora_x0y11_1/reset_pb]
connect_bd_net [get_bd_pins auto_reset_aurora_1/reset_pb] [get_bd_pins aurora_x0y11_0/reset_pb]
connect_bd_net [get_bd_pins init_clk] \
  [get_bd_pins aurora_x0y11_1/init_clk] [get_bd_pins aurora_x0y11_0/init_clk] [get_bd_pins auto_reset_aurora_0/i_clk] \
  [get_bd_pins auto_reset_aurora_1/i_clk]
connect_bd_net [get_bd_pins pma_init] [get_bd_pins aurora_x0y11_0/pma_init]
connect_bd_net [get_bd_pins pma_init_1] [get_bd_pins aurora_x0y11_1/pma_init]

current_bd_instance /
connect_bd_intf_net [get_bd_intf_ports GT_SERIAL_RX_X0Y11_C0] [get_bd_intf_pins hier_x0y11/GT_SERIAL_RX_C0]
connect_bd_intf_net [get_bd_intf_ports GT_SERIAL_RX_X0Y11_C1] [get_bd_intf_pins hier_x0y11/GT_SERIAL_RX_C1]
connect_bd_intf_net [get_bd_intf_ports GT_SERIAL_RX_X0Y13_C0] [get_bd_intf_pins hier_x0y13/GT_SERIAL_RX_C0]
connect_bd_intf_net [get_bd_intf_ports GT_SERIAL_RX_X0Y13_C1] [get_bd_intf_pins hier_x0y13/GT_SERIAL_RX_C1]
connect_bd_intf_net [get_bd_intf_ports S_AXIS_X0Y11_C0] [get_bd_intf_pins axis_register_slice_0/S_AXIS]
connect_bd_intf_net [get_bd_intf_ports S_AXIS_X0Y11_C1] [get_bd_intf_pins axis_register_slice_1/S_AXIS]
connect_bd_intf_net [get_bd_intf_ports S_AXIS_X0Y13_C0] [get_bd_intf_pins axis_register_slice_2/S_AXIS]
connect_bd_intf_net [get_bd_intf_ports S_AXIS_X0Y13_C1] [get_bd_intf_pins axis_register_slice_3/S_AXIS]
connect_bd_intf_net [get_bd_intf_pins axis_data_fifo_0/M_AXIS] [get_bd_intf_pins hier_x0y13/S_AXIS_TX_C0]
connect_bd_intf_net [get_bd_intf_ports M_AXIS_X0Y13_C0] [get_bd_intf_pins axis_data_fifo_1/M_AXIS]
connect_bd_intf_net [get_bd_intf_pins hier_x0y13/S_AXIS_TX_C1] [get_bd_intf_pins axis_data_fifo_2/M_AXIS]
connect_bd_intf_net [get_bd_intf_ports M_AXIS_X0Y13_C1] [get_bd_intf_pins axis_data_fifo_3/M_AXIS]
connect_bd_intf_net [get_bd_intf_pins axis_data_fifo_4/M_AXIS] [get_bd_intf_pins hier_x0y11/S_AXIS_TX_C0]
connect_bd_intf_net [get_bd_intf_pins axis_data_fifo_5/M_AXIS] [get_bd_intf_pins hier_x0y11/S_AXIS_TX_C1]
connect_bd_intf_net [get_bd_intf_ports M_AXIS_X0Y11_C0] [get_bd_intf_pins axis_data_fifo_6/M_AXIS]
connect_bd_intf_net [get_bd_intf_ports M_AXIS_X0Y11_C1] [get_bd_intf_pins axis_data_fifo_7/M_AXIS]
connect_bd_intf_net [get_bd_intf_pins axis_register_slice_0/M_AXIS] [get_bd_intf_pins axis_data_fifo_4/S_AXIS]
connect_bd_intf_net [get_bd_intf_pins axis_register_slice_1/M_AXIS] [get_bd_intf_pins axis_data_fifo_5/S_AXIS]
connect_bd_intf_net [get_bd_intf_pins axis_register_slice_2/M_AXIS] [get_bd_intf_pins axis_data_fifo_0/S_AXIS]
connect_bd_intf_net [get_bd_intf_pins axis_register_slice_3/M_AXIS] [get_bd_intf_pins axis_data_fifo_2/S_AXIS]
connect_bd_intf_net [get_bd_intf_ports gt_x0y11_diff_ref] [get_bd_intf_pins hier_x0y11/GT_REFCLK]
connect_bd_intf_net [get_bd_intf_ports gt_x0y13_diff_ref] [get_bd_intf_pins hier_x0y13/GT_REFCLK]
connect_bd_intf_net [get_bd_intf_ports GT_SERIAL_TX_X0Y11_C0] [get_bd_intf_pins hier_x0y11/GT_SERIAL_TX_C0]
connect_bd_intf_net [get_bd_intf_ports GT_SERIAL_TX_X0Y11_C1] [get_bd_intf_pins hier_x0y11/GT_SERIAL_TX_C1]
connect_bd_intf_net [get_bd_intf_pins hier_x0y11/M_AXIS_RX_C0] [get_bd_intf_pins axis_data_fifo_6/S_AXIS]
connect_bd_intf_net [get_bd_intf_pins hier_x0y11/M_AXIS_RX_C1] [get_bd_intf_pins axis_data_fifo_7/S_AXIS]
connect_bd_intf_net [get_bd_intf_ports GT_SERIAL_TX_X0Y13_C0] [get_bd_intf_pins hier_x0y13/GT_SERIAL_TX_C0]
connect_bd_intf_net [get_bd_intf_ports GT_SERIAL_TX_X0Y13_C1] [get_bd_intf_pins hier_x0y13/GT_SERIAL_TX_C1]
connect_bd_intf_net [get_bd_intf_pins axis_data_fifo_1/S_AXIS] [get_bd_intf_pins hier_x0y13/M_AXIS_RX_C0]
connect_bd_intf_net [get_bd_intf_pins axis_data_fifo_3/S_AXIS] [get_bd_intf_pins hier_x0y13/M_AXIS_RX_C1]
connect_bd_net [get_bd_pins hier_x0y11/arstn_c0] [get_bd_pins xpm_cdc_gen_2/src_arst] [get_bd_pins axis_data_fifo_6/s_axis_aresetn]
connect_bd_net [get_bd_pins hier_x0y11/arstn_c1] [get_bd_pins xpm_cdc_gen_3/src_arst] [get_bd_pins axis_data_fifo_7/s_axis_aresetn]
connect_bd_net [get_bd_pins hier_x0y11/user_clk_out] \
  [get_bd_pins axis_data_fifo_4/m_axis_aclk] [get_bd_pins axis_data_fifo_5/m_axis_aclk] \
  [get_bd_pins axis_data_fifo_6/s_axis_aclk] [get_bd_pins axis_data_fifo_7/s_axis_aclk]
connect_bd_net [get_bd_pins hier_x0y13/arstn_c0] [get_bd_pins xpm_cdc_gen_0/src_arst] [get_bd_pins axis_data_fifo_1/s_axis_aresetn]
connect_bd_net [get_bd_pins hier_x0y13/arstn_c1] [get_bd_pins xpm_cdc_gen_1/src_arst] [get_bd_pins axis_data_fifo_3/s_axis_aresetn]
connect_bd_net [get_bd_pins hier_x0y13/user_clk_out] \
  [get_bd_pins axis_data_fifo_0/m_axis_aclk] [get_bd_pins axis_data_fifo_2/m_axis_aclk] \
  [get_bd_pins axis_data_fifo_1/s_axis_aclk] [get_bd_pins axis_data_fifo_3/s_axis_aclk]
connect_bd_net [get_bd_ports ini_pma_rst] [get_bd_pins ini_system_1/i_pma_rst]
connect_bd_net [get_bd_pins ini_system_1/ini_pma] \
  [get_bd_pins hier_x0y13/pma_init] [get_bd_pins hier_x0y13/pma_init_1] [get_bd_pins hier_x0y11/pma_init] \
  [get_bd_pins hier_x0y11/pma_init_1]
connect_bd_net [get_bd_ports init_clk] [get_bd_pins hier_x0y13/init_clk] [get_bd_pins hier_x0y11/init_clk] [get_bd_pins ini_system_1/i_clk]
connect_bd_net [get_bd_ports s_axis_aclk] \
  [get_bd_pins axis_data_fifo_0/s_axis_aclk] [get_bd_pins axis_data_fifo_2/s_axis_aclk] [get_bd_pins xpm_cdc_gen_0/dest_clk] \
  [get_bd_pins xpm_cdc_gen_1/dest_clk] [get_bd_pins axis_data_fifo_1/m_axis_aclk] [get_bd_pins axis_data_fifo_3/m_axis_aclk] \
  [get_bd_pins axis_data_fifo_4/s_axis_aclk] [get_bd_pins axis_data_fifo_5/s_axis_aclk] [get_bd_pins xpm_cdc_gen_2/dest_clk] \
  [get_bd_pins xpm_cdc_gen_3/dest_clk] [get_bd_pins axis_data_fifo_6/m_axis_aclk] [get_bd_pins axis_data_fifo_7/m_axis_aclk] \
  [get_bd_pins axis_register_slice_0/aclk] [get_bd_pins axis_register_slice_1/aclk] [get_bd_pins axis_register_slice_2/aclk] \
  [get_bd_pins axis_register_slice_3/aclk]
connect_bd_net [get_bd_pins xpm_cdc_gen_0/dest_arst] [get_bd_pins axis_data_fifo_0/s_axis_aresetn] [get_bd_pins axis_register_slice_2/aresetn]
connect_bd_net [get_bd_pins xpm_cdc_gen_1/dest_arst] [get_bd_pins axis_data_fifo_2/s_axis_aresetn] [get_bd_pins axis_register_slice_3/aresetn]
connect_bd_net [get_bd_pins xpm_cdc_gen_2/dest_arst] [get_bd_pins axis_data_fifo_4/s_axis_aresetn] [get_bd_pins axis_register_slice_0/aresetn]
connect_bd_net [get_bd_pins xpm_cdc_gen_3/dest_arst] [get_bd_pins axis_data_fifo_5/s_axis_aresetn] [get_bd_pins axis_register_slice_1/aresetn]

validate_bd_design
save_bd_design
